# Altium project tsPicoVid.PrjPcb
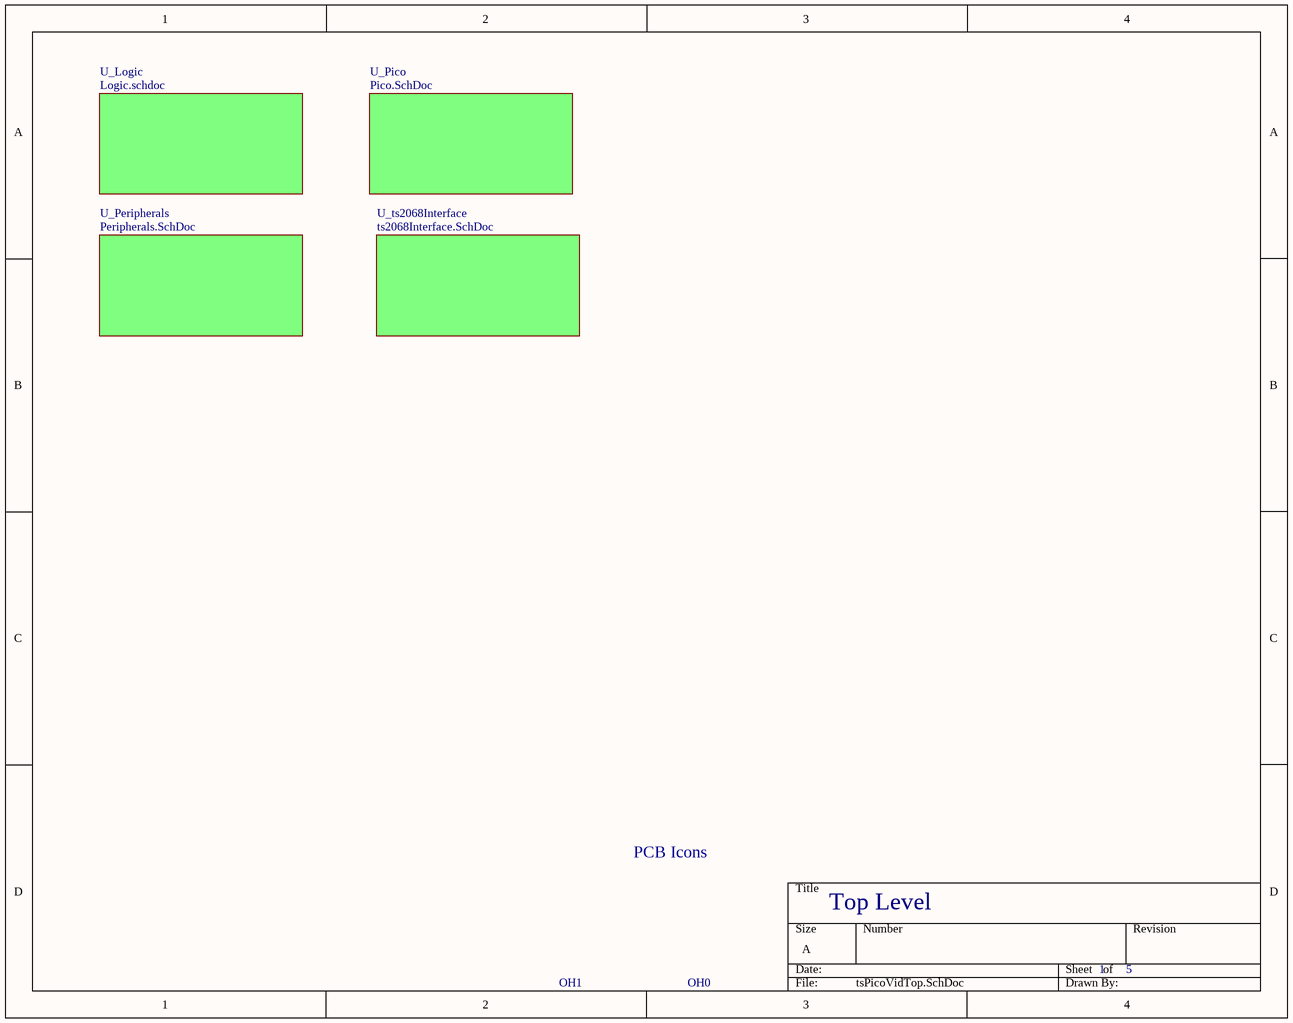
[diagram p0: tsPicoVidTop.SchDoc]
5 sheets, 47 parts. Net scope: global (net labels, ports and power ports of the same name join across sheets).
Sheets:
  tsPicoVidTop.SchDoc
    U_Logic = Logic.schdoc
    U_Pico = Pico.SchDoc
    U_ts2068Interface = ts2068Interface.SchDoc
    U_Peripherals = Peripherals.SchDoc

## Sheet tsPicoVidTop.SchDoc
size A; SheetNumber: 1; SheetTotal: 5

### Parts
OH0  OPENHW_PCB  [OpenHW]  (value not drawn)
OH1  OPENHW_SCH  (value not drawn)

### Sub-sheets
U_Logic = Logic.schdoc: no entries
U_Peripherals = Peripherals.SchDoc: no entries
U_Pico = Pico.SchDoc: no entries
U_ts2068Interface = ts2068Interface.SchDoc: no entries

### Notes on the sheet
- PCB Icons
- Top Level

## Sheet Logic.schdoc
size A; SheetNumber: 3; SheetTotal: 5
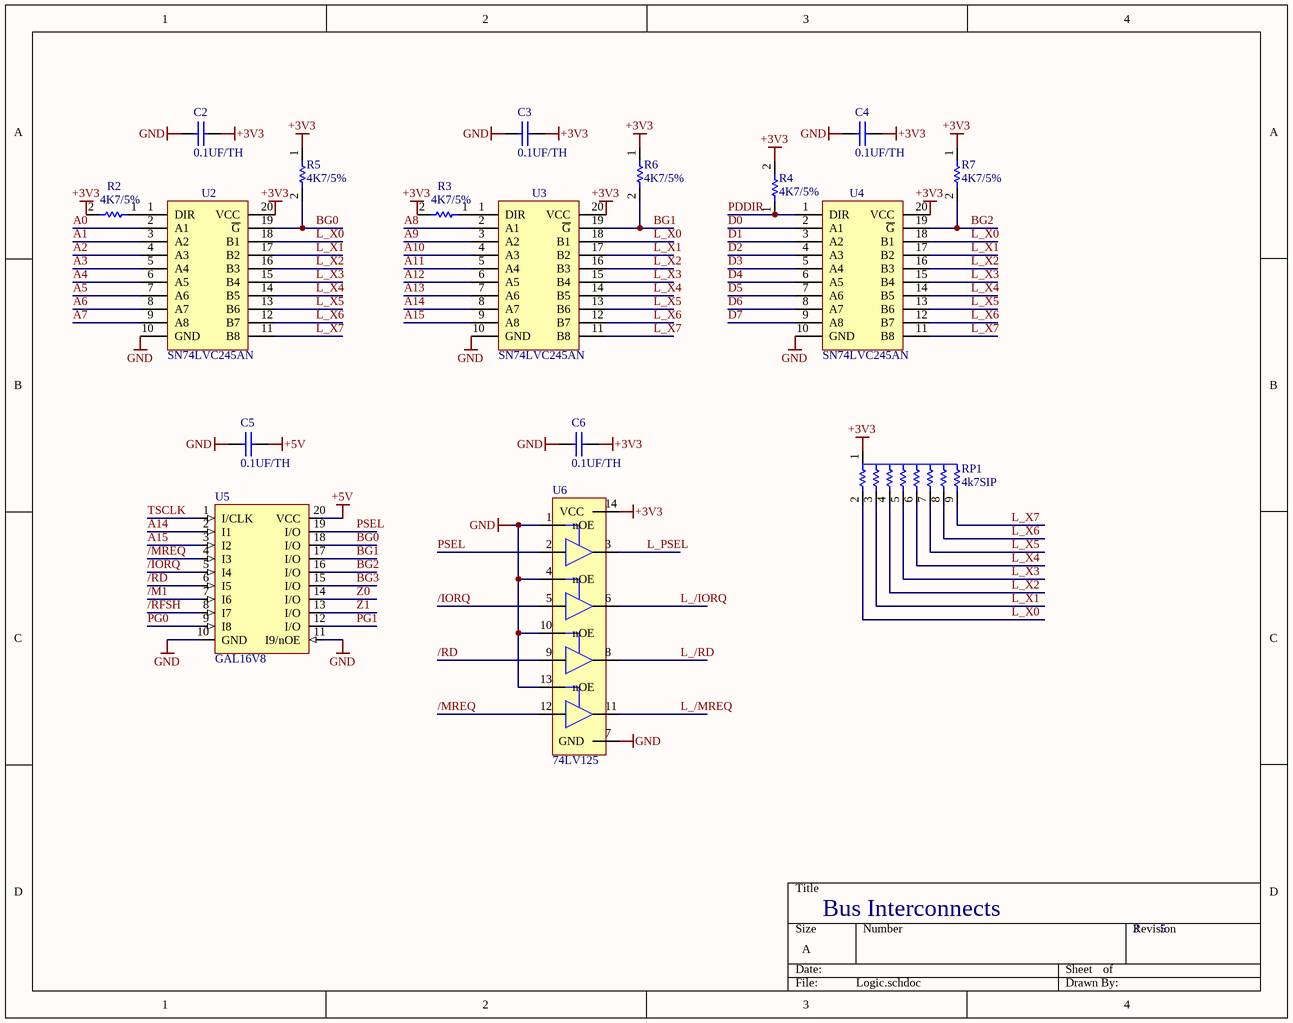
[diagram p1: Logic.schdoc]

### Parts
C2  0.1UF/TH  [CAPH5]
C3  0.1UF/TH  [CAPH5]
C4  0.1UF/TH  [CAPH5]
C5  0.1UF/TH  [CAPH5]
C6  0.1UF/TH  [CAPH5]
R2  4K7/5%  [CF18]
R3  4K7/5%  [CF18]
R4  4K7/5%  [CF18]
R5  4K7/5%  [CF18]
R6  4K7/5%  [CF18]
R7  4K7/5%  [CF18]
RP1  4k7SIP  [SIP9]
U2  SN74LVC245AN  [DIP20]
U3  SN74LVC245AN  [DIP20]
U4  SN74LVC245AN  [DIP20]
U5  GAL16V8  [DIP20]
U6  74LV125  [dip14]

### Nets
+3V3: C2.2 C3.2 C4.2 C6.2 R2.2 R3.2 R4.2 R5.1 R6.1 R7.1 RP1.1 U2.20(VCC) U3.20(VCC) U4.20(VCC) U6.14(VCC)
+5V: C5.2 U5.20(VCC)
GND: C2.1 C3.1 C4.1 C5.1 C6.1 U2.10(GND) U3.10(GND) U4.10(GND) U5.10(GND) U5.11(I9/nOE) U6.1(nOE) U6.4(nOE) U6.7(GND) U6.10(nOE) U6.13(nOE)
/IORQ: U5.5(I4) U6.5
/M1: U5.7(I6)
/MREQ: U5.4(I3) U6.12
/RD: U5.6(I5) U6.9
/RFSH: U5.8(I7)
A0: U2.2(A1)
A1: U2.3(A2)
A2: U2.4(A3)
A3: U2.5(A4)
A4: U2.6(A5)
A5: U2.7(A6)
A6: U2.8(A7)
A7: U2.9(A8)
A8: U3.2(A1)
A9: U3.3(A2)
A10: U3.4(A3)
A11: U3.5(A4)
A12: U3.6(A5)
A13: U3.7(A6)
A14: U3.8(A7) U5.2(I1)
A15: U3.9(A8) U5.3(I2)
BG0: R5.2 U2.19(~{G}) U5.18(I/O)
BG1: R6.2 U3.19(~{G}) U5.17(I/O)
BG2: R7.2 U4.19(~{G}) U5.16(I/O)
BG3: U5.15(I/O)
D0: U4.2(A1)
D1: U4.3(A2)
D2: U4.4(A3)
D3: U4.5(A4)
D4: U4.6(A5)
D5: U4.7(A6)
D6: U4.8(A7)
D7: U4.9(A8)
L_/IORQ: U6.6
L_/MREQ: U6.11
L_/RD: U6.8
L_PSEL: U6.3
L_X0: RP1.2 U2.18(B1) U3.18(B1) U4.18(B1)
L_X1: RP1.3 U2.17(B2) U3.17(B2) U4.17(B2)
L_X2: RP1.4 U2.16(B3) U3.16(B3) U4.16(B3)
L_X3: RP1.5 U2.15(B4) U3.15(B4) U4.15(B4)
L_X4: RP1.6 U2.14(B5) U3.14(B5) U4.14(B5)
L_X5: RP1.7 U2.13(B6) U3.13(B6) U4.13(B6)
L_X6: RP1.8 U2.12(B7) U3.12(B7) U4.12(B7)
L_X7: RP1.9 U2.11(B8) U3.11(B8) U4.11(B8)
PDDIR: R4.1 U4.1(DIR)
PG0: U5.9(I8)
PG1: U5.12(I/O)
PSEL: U5.19(I/O) U6.2
TSCLK: U5.1(I/CLK)
Z0: U5.14(I/O)
Z1: U5.13(I/O)
NetR2_1: R2.1 U2.1(DIR)
NetR3_1: R3.1 U3.1(DIR)

### Notes on the sheet
- Bus Interconnects

### Library data of the parts
C2-C6 = 0.1UF/TH: 0.1 µF ±10% 50V Ceramic Capacitor X7R Radial; MFG: Vishay; MFG PN: K104K10X7RF5UH5; DK PN: BC2665CT-ND; Price: 1.17
R2-R7 = 4K7/5%: RES 4.7K OHM 5% 1/8W AXIAL; MFG PN: CF18JT4K70; DK PN: CF18JT4K70CT-ND; MFG: Stackpole; Populate: *
RP1 = 4k7SIP: 4.7k Ohm ±2% 200mW Power Per Element Bussed Resistor Network/Array ±100ppm/°C 9-SIP; MFG: Bournes; MFG PN: 4609X-101-472LF; DK PN: 4609X-101-472LF-ND; Populate: *
U2-U4 = SN74LVC245AN: Transceiver, Non-Inverting 1 Element 8 Bit per Element 3-State Output 20-PDIP; MFG: TI; DK PN: 296-8503-5-ND; MFG PN: SN74LVC245AN; Price: 1.17
U5 = GAL16V8: GAL16V8 Programmable Logic Device (PLD) IC 8 Macrocells 20-PDIP; MFG: Microchip; MFG PN: ATF16V8C-7PU; Price: 1.17; MFG PN 2: ATF16V8CZ-15PU
U6 = 74LV125: Buffer, Non-Inverting 4 Element 1 Bit per Element 3-State Output 14-SOIC; MFG: TI; MFG PN: SN74LV125AN; DK PN: 296-34037-5-ND; Price: 1.17

## Sheet Pico.SchDoc: Mass Storage
size A; SheetNumber: 4; SheetTotal: 7
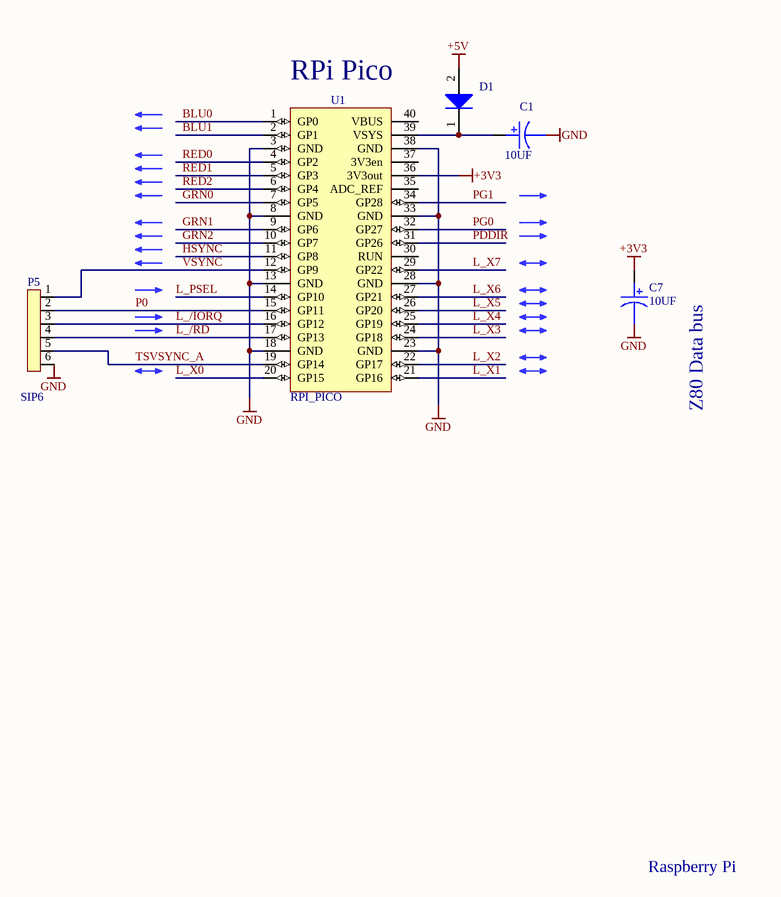
[diagram p2: Pico.SchDoc]

### Parts
C1  10UF  [CAP10EL]
C7  10UF  [CAP10EL]
D1  SB260_R2_00001  [DO-15]  (value not drawn)
P5  SIP6  [SIP6]
U1  RPI_PICO  [RPIPICO]

### Nets
+3V3: C7.1 U1.36(3V3out)
+5V: D1.2(A)
GND: C1.2 C7.2 P5.6 U1.3(GND) U1.8(GND) U1.13(GND) U1.18(GND) U1.23(GND) U1.28(GND) U1.33(GND) U1.38(GND)
BLU0: U1.1(GP0)
BLU1: U1.2(GP1)
GRN0: U1.7(GP5)
GRN1: U1.9(GP6)
GRN2: U1.10(GP7)
HSYNC: U1.11(GP8)
L_/IORQ: P5.3 U1.16(GP12)
L_/RD: P5.4 U1.17(GP13)
L_PSEL: U1.14(GP10)
L_X0: U1.20(GP15)
L_X1: U1.21(GP16)
L_X2: U1.22(GP17)
L_X3: U1.24(GP18)
L_X4: U1.25(GP19)
L_X5: U1.26(GP20)
L_X6: U1.27(GP21)
L_X7: U1.29(GP22)
P0: P5.2 U1.15(GP11)
PDDIR: U1.31(GP26)
PG0: U1.32(GP27)
PG1: U1.34(GP28)
RED0: U1.4(GP2)
RED1: U1.5(GP3)
RED2: U1.6(GP4)
TSVSYNC_A: P5.5 U1.19(GP14)
VSYNC: P5.1 U1.12(GP9)
NetC1_1: C1.1 D1.1 U1.39(VSYS)

Not connected (* = marked no-connect by the designer): U1 30(RUN) 35(ADC_REF) 37(3V3en) 40(VBUS)

### Notes on the sheet
- RPi Pico
- (near C7) Z80 Data bus
- Raspberry Pi

### Library data of the parts
C1 C7 = 10UF: CAP ALUM 10UF 20% 16V RADIAL; MFG: Panasonic; MFG PN: ECE-A1CKA100; DK PN: P807-ND
D1 = SB260_R2_00001: DIODE SCHOTTKY 60V 2A DO15; DK PN: 3757-SB260_R2_00001CT-ND; MFG: Panjit; MFG PN: SB260_R2_00001; FOOTPRINT: DO15; Populate: *
U1 = RPI_PICO: RASPBERRY PI PICO RP2040 BOARD; MFG PN: SC0915; DK PN: 2648-SC0915CT-ND; MFG: Raspberry Pi; Populate: *

## Sheet ts2068Interface.SchDoc
size A; SheetNumber: 2; SheetTotal: 5
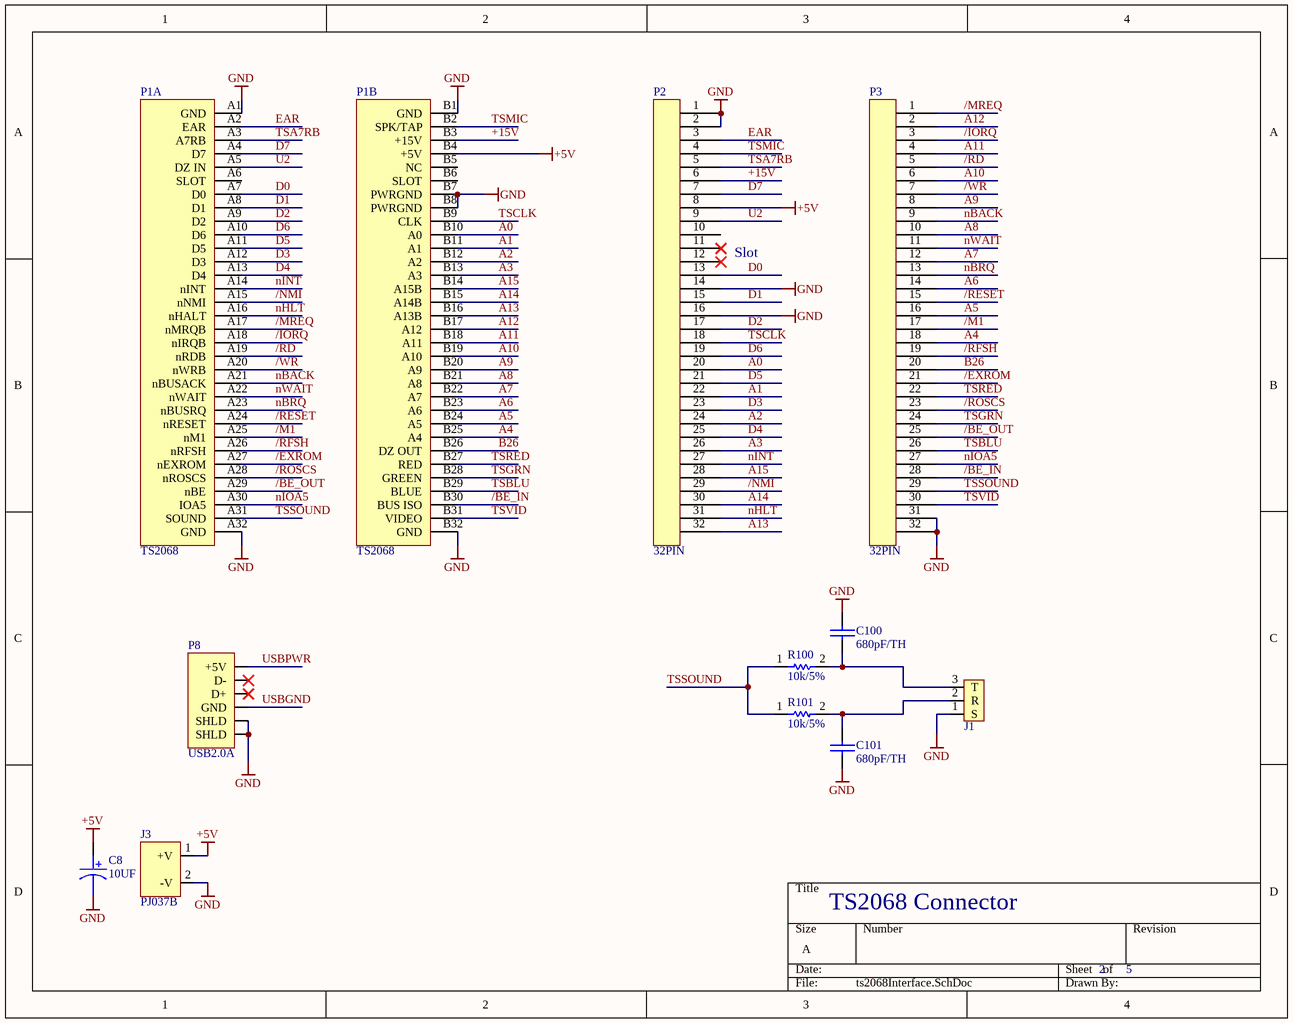
[diagram p3: ts2068Interface.SchDoc]

### Parts
C8  10UF  [CAP10EL]
C100  680pF/TH  [WIMIA_BOX2.7X4.5]
C101  680pF/TH  [WIMIA_BOX2.7X4.5]
J1  STX-3000  [STX-3000]  (value not drawn)
J3  PJ037B  [PJ037B]
P1  TS2068  [TS2068A]  (parts A,B of 2)
P2  32PIN  [IDC32]
P3  32PIN  [IDC32]
P8  USB2.0A  [USBA_AU-Y1005]
R100  10k/5%  [CF18]
R101  10k/5%  [CF18]

### Nets
+5V: C8.1 J3.1(+V) P1.B4(+5V) P2.8
GND: C8.2 C100.1 C101.2 J1.1(S) J3.2(-V) P1.A1(GND) P1.A32(GND) P1.B1(GND) P1.B7(PWRGND) P1.B8(PWRGND) P1.B32(GND) P2.1 P2.2 P2.14 P2.16 P3.31 P3.32 P8.5(SHLD) P8.6(SHLD)
+15V: P1.B3(+15V) P2.6
/BE_IN: P1.B30(BUS_ISO) P3.28
/BE_OUT: P1.A29(nBE) P3.25
/EXROM: P1.A27(nEXROM) P3.21
/IORQ: P1.A18(nIRQB) P3.3
/M1: P1.A25(nM1) P3.17
/MREQ: P1.A17(nMRQB) P3.1
/NMI: P1.A15(nNMI) P2.29
/RD: P1.A19(nRDB) P3.5
/RESET: P1.A24(nRESET) P3.15
/RFSH: P1.A26(nRFSH) P3.19
/ROSCS: P1.A28(nROSCS) P3.23
/WR: P1.A20(nWRB) P3.7
A0: P1.B10(A0) P2.20
A1: P1.B11(A1) P2.22
A2: P1.B12(A2) P2.24
A3: P1.B13(A3) P2.26
A4: P1.B25(A4) P3.18
A5: P1.B24(A5) P3.16
A6: P1.B23(A6) P3.14
A7: P1.B22(A7) P3.12
A8: P1.B21(A8) P3.10
A9: P1.B20(A9) P3.8
A10: P1.B19(A10) P3.6
A11: P1.B18(A11) P3.4
A12: P1.B17(A12) P3.2
A13: P1.B16(A13B) P2.32
A14: P1.B15(A14B) P2.30
A15: P1.B14(A15B) P2.28
B26: P1.B26(DZ_OUT) P3.20
D0: P1.A7(D0) P2.13
D1: P1.A8(D1) P2.15
D2: P1.A9(D2) P2.17
D3: P1.A12(D3) P2.23
D4: P1.A13(D4) P2.25
D5: P1.A11(D5) P2.21
D6: P1.A10(D6) P2.19
D7: P1.A4(D7) P2.7
EAR: P1.A2(EAR) P2.3
nBACK: P1.A21(nBUSACK) P3.9
nBRQ: P1.A23(nBUSRQ) P3.13
nHLT: P1.A16(nHALT) P2.31
nINT: P1.A14(nINT) P2.27
nIOA5: P1.A30(IOA5) P3.27
nWAIT: P1.A22(nWAIT) P3.11
TSA7RB: P1.A3(A7RB) P2.5
TSBLU: P1.B29(BLUE) P3.26
TSCLK: P1.B9(CLK) P2.18
TSGRN: P1.B28(GREEN) P3.24
TSMIC: P1.B2(SPK/TAP) P2.4
TSRED: P1.B27(RED) P3.22
TSSOUND: P1.A31(SOUND) P3.29 R100.1 R101.1
TSVID: P1.B31(VIDEO) P3.30
U2: P1.A5(DZ_IN) P2.9
USBGND: P8.4(GND)
USBPWR: P8.1(+5V)
NetC100_2: C100.2 J1.3(T) R100.2
NetC101_1: C101.1 J1.2(R) R101.2

Not connected (* = marked no-connect by the designer): P1 A6(SLOT) B5(NC) B6(SLOT); P2 10 11* 12*; P8 2(D-)* 3(D+)*

### Notes on the sheet
- Slot
- TS2068 Connector

### Library data of the parts
C8 = 10UF: as C1 on sheet Pico
C100 C101 = 680pF/TH: CAP FILM 680PF 10% 100VDC RAD; MFG: WIMA; MFG PN: FKP2D006801D00KSSD; DK PN: 1928-1238-ND; Price: 1.17
J1 = STX-3000: 3.50mm (0.141", 1/8", Mini Plug) - Headphone Phone Jack Stereo (3 Conductor, TRS) Connector Kinked Pin; DK PN: 2092-STX-3000-ND; MFG: Kycon, Inc.; MFG PN: STX-3000
J3 = PJ037B: Power Barrel Connector Jack 2.50mm ID (0.098"), 5.50mm OD (0.217") Through Hole, Right Angle; MFG PN: PJ-037B; DK PN: CP-037B-ND; MFG: CUI
P8 = USB2.0A: USB-A (USB TYPE-A) USB 2.0 Receptacle Connector 4 Position Through Hole, Right Angle; MFG: Adam Tech; MFG PN: USB-A-S-RA; DK PN: 2057-USB-A-S-RA-ND
R100 R101 = 10k/5%: RES 10K OHM 5% 1/8W AXIAL; MFG PN: CF18JT10K0; DK PN: CF18JT10K0CT-ND; MFG: Stackpole; Populate: *
P1 = TS2068: Populate: *
P2 P3 = 32PIN: MFG: *; MFG PN: *; DK PN: *; Price: *

## Sheet Peripherals.SchDoc
size A; SheetNumber: 4; SheetTotal: 5
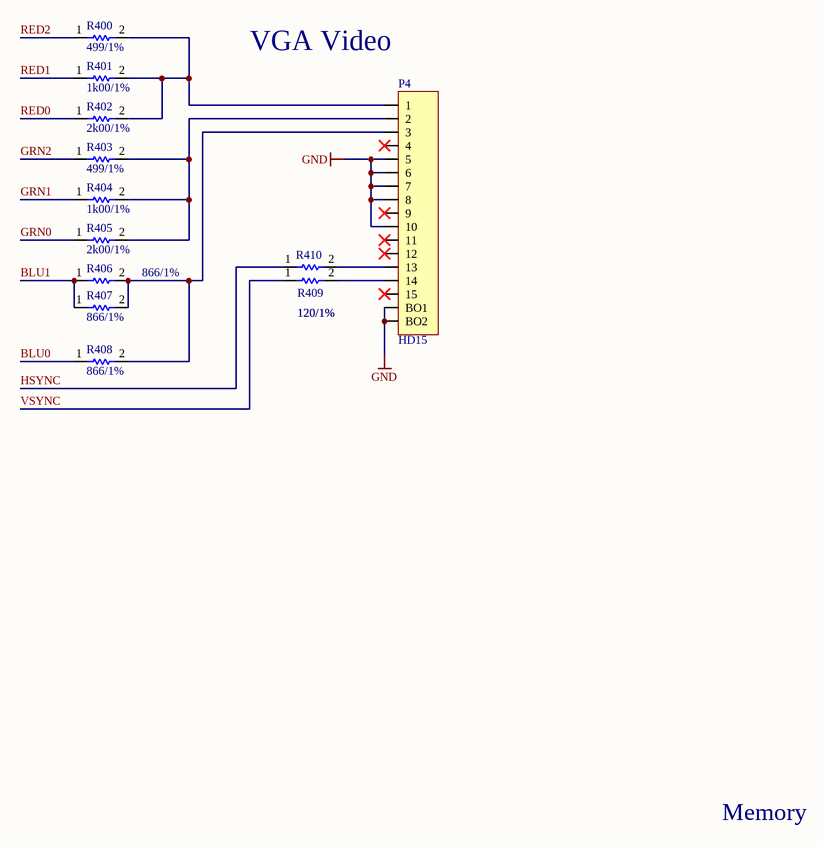
[diagram p4: Peripherals.SchDoc]

### Parts
P4  HD15  [DB15FLC]
R400  499/1%  [RNF14]
R401  1k00/1%  [RNF14]
R402  2k00/1%  [RNF14]
R403  499/1%  [RNF14]
R404  1k00/1%  [RNF14]
R405  2k00/1%  [RNF14]
R406  866/1%  [RNF14]
R407  866/1%  [RNF14]
R408  866/1%  [RNF14]
R409  120/1%  [RNF14]
R410  120/1%  [RNF14]

### Nets
GND: P4.5 P4.6 P4.7 P4.8 P4.10 P4.BO1 P4.BO2
BLU0: R408.1
BLU1: R406.1 R407.1
GRN0: R405.1
GRN1: R404.1
GRN2: R403.1
HSYNC: R410.1
RED0: R402.1
RED1: R401.1
RED2: R400.1
VSYNC: R409.1
NetP4_1: P4.1 R400.2 R401.2 R402.2
NetP4_2: P4.2 R403.2 R404.2 R405.2
NetP4_3: P4.3 R406.2 R407.2 R408.2
NetP4_13: P4.13 R410.2
NetP4_14: P4.14 R409.2

Not connected (* = marked no-connect by the designer): P4 4* 9* 11* 12* 15*

### Notes on the sheet
- (near P4) VGA Video
- Memory

### Library data of the parts
P4 = HD15: CONN DSUB HD RCPT 15POS R/A SLDR; Text Field1: Amphenol; Mfg PN: ICD15S13E4GX00LF; DK PN: 609-5181-ND
R400 R403 = 499/1%: RES 499 OHM 1% 1/4W AXIAL; MFG PN: RNF14FTD499R; DK PN: RNF14FTD499RCT-ND; MFG: Stackpole; Populate: *
R401 R404 = 1k00/1%: RES 1K OHM 1% 1/4W AXIAL; MFG PN: RNF14FTD1K00; DK PN: RNF14FTD1K00CT-ND; MFG: Stackpole; Populate: *
R402 R405 = 2k00/1%: RES 2K OHM 1% 1/4W AXIAL; MFG PN: RNF14FTD2K00; DK PN: RNF14FTD2K00CT-ND; MFG: Stackpole; Populate: *
R406-R408 = 866/1%: RES 866 OHM 1% 1/4W AXIAL; MFG PN: RNF14FTD866R; DK PN: RNF14FTD866RCT-ND; MFG: Stackpole; Populate: *
R409 R410 = 120/1%: RES 120 OHM 1% 1/4W AXIAL; MFG PN: RNMF14FTC120R; DK PN: S120CACT-ND; MFG: Stackpole; Populate: *

## Nets that join several sheets
+3V3: Logic (15 pins), Pico (C7.1 U1.36)
+5V: Logic (C5.2 U5.20), Pico (D1.2), ts2068Interface (C8.1 J3.1 P1.B4 P2.8)
GND: Logic (15 pins), Pico (11 pins), ts2068Interface (19 pins), Peripherals (7 pins)
/IORQ: Logic (U5.5 U6.5), ts2068Interface (P1.A18 P3.3)
/M1: Logic (U5.7), ts2068Interface (P1.A25 P3.17)
/MREQ: Logic (U5.4 U6.12), ts2068Interface (P1.A17 P3.1)
/RD: Logic (U5.6 U6.9), ts2068Interface (P1.A19 P3.5)
/RFSH: Logic (U5.8), ts2068Interface (P1.A26 P3.19)
A0: Logic (U2.2), ts2068Interface (P1.B10 P2.20)
A1: Logic (U2.3), ts2068Interface (P1.B11 P2.22)
A2: Logic (U2.4), ts2068Interface (P1.B12 P2.24)
A3: Logic (U2.5), ts2068Interface (P1.B13 P2.26)
A4: Logic (U2.6), ts2068Interface (P1.B25 P3.18)
A5: Logic (U2.7), ts2068Interface (P1.B24 P3.16)
A6: Logic (U2.8), ts2068Interface (P1.B23 P3.14)
A7: Logic (U2.9), ts2068Interface (P1.B22 P3.12)
A8: Logic (U3.2), ts2068Interface (P1.B21 P3.10)
A9: Logic (U3.3), ts2068Interface (P1.B20 P3.8)
A10: Logic (U3.4), ts2068Interface (P1.B19 P3.6)
A11: Logic (U3.5), ts2068Interface (P1.B18 P3.4)
A12: Logic (U3.6), ts2068Interface (P1.B17 P3.2)
A13: Logic (U3.7), ts2068Interface (P1.B16 P2.32)
A14: Logic (U3.8 U5.2), ts2068Interface (P1.B15 P2.30)
A15: Logic (U3.9 U5.3), ts2068Interface (P1.B14 P2.28)
BLU0: Pico (U1.1), Peripherals (R408.1)
BLU1: Pico (U1.2), Peripherals (R406.1 R407.1)
D0: Logic (U4.2), ts2068Interface (P1.A7 P2.13)
D1: Logic (U4.3), ts2068Interface (P1.A8 P2.15)
D2: Logic (U4.4), ts2068Interface (P1.A9 P2.17)
D3: Logic (U4.5), ts2068Interface (P1.A12 P2.23)
D4: Logic (U4.6), ts2068Interface (P1.A13 P2.25)
D5: Logic (U4.7), ts2068Interface (P1.A11 P2.21)
D6: Logic (U4.8), ts2068Interface (P1.A10 P2.19)
D7: Logic (U4.9), ts2068Interface (P1.A4 P2.7)
GRN0: Pico (U1.7), Peripherals (R405.1)
GRN1: Pico (U1.9), Peripherals (R404.1)
GRN2: Pico (U1.10), Peripherals (R403.1)
HSYNC: Pico (U1.11), Peripherals (R410.1)
L_/IORQ: Logic (U6.6), Pico (P5.3 U1.16)
L_/RD: Logic (U6.8), Pico (P5.4 U1.17)
L_PSEL: Logic (U6.3), Pico (U1.14)
L_X0: Logic (RP1.2 U2.18 U3.18 U4.18), Pico (U1.20)
L_X1: Logic (RP1.3 U2.17 U3.17 U4.17), Pico (U1.21)
L_X2: Logic (RP1.4 U2.16 U3.16 U4.16), Pico (U1.22)
L_X3: Logic (RP1.5 U2.15 U3.15 U4.15), Pico (U1.24)
L_X4: Logic (RP1.6 U2.14 U3.14 U4.14), Pico (U1.25)
L_X5: Logic (RP1.7 U2.13 U3.13 U4.13), Pico (U1.26)
L_X6: Logic (RP1.8 U2.12 U3.12 U4.12), Pico (U1.27)
L_X7: Logic (RP1.9 U2.11 U3.11 U4.11), Pico (U1.29)
PDDIR: Logic (R4.1 U4.1), Pico (U1.31)
PG0: Logic (U5.9), Pico (U1.32)
PG1: Logic (U5.12), Pico (U1.34)
RED0: Pico (U1.4), Peripherals (R402.1)
RED1: Pico (U1.5), Peripherals (R401.1)
RED2: Pico (U1.6), Peripherals (R400.1)
TSCLK: Logic (U5.1), ts2068Interface (P1.B9 P2.18)
VSYNC: Pico (P5.1 U1.12), Peripherals (R409.1)